# Altium schematic sheet Clock_7Segment.SchDoc
size A3; SheetNumber: 8; SheetTotal: 16
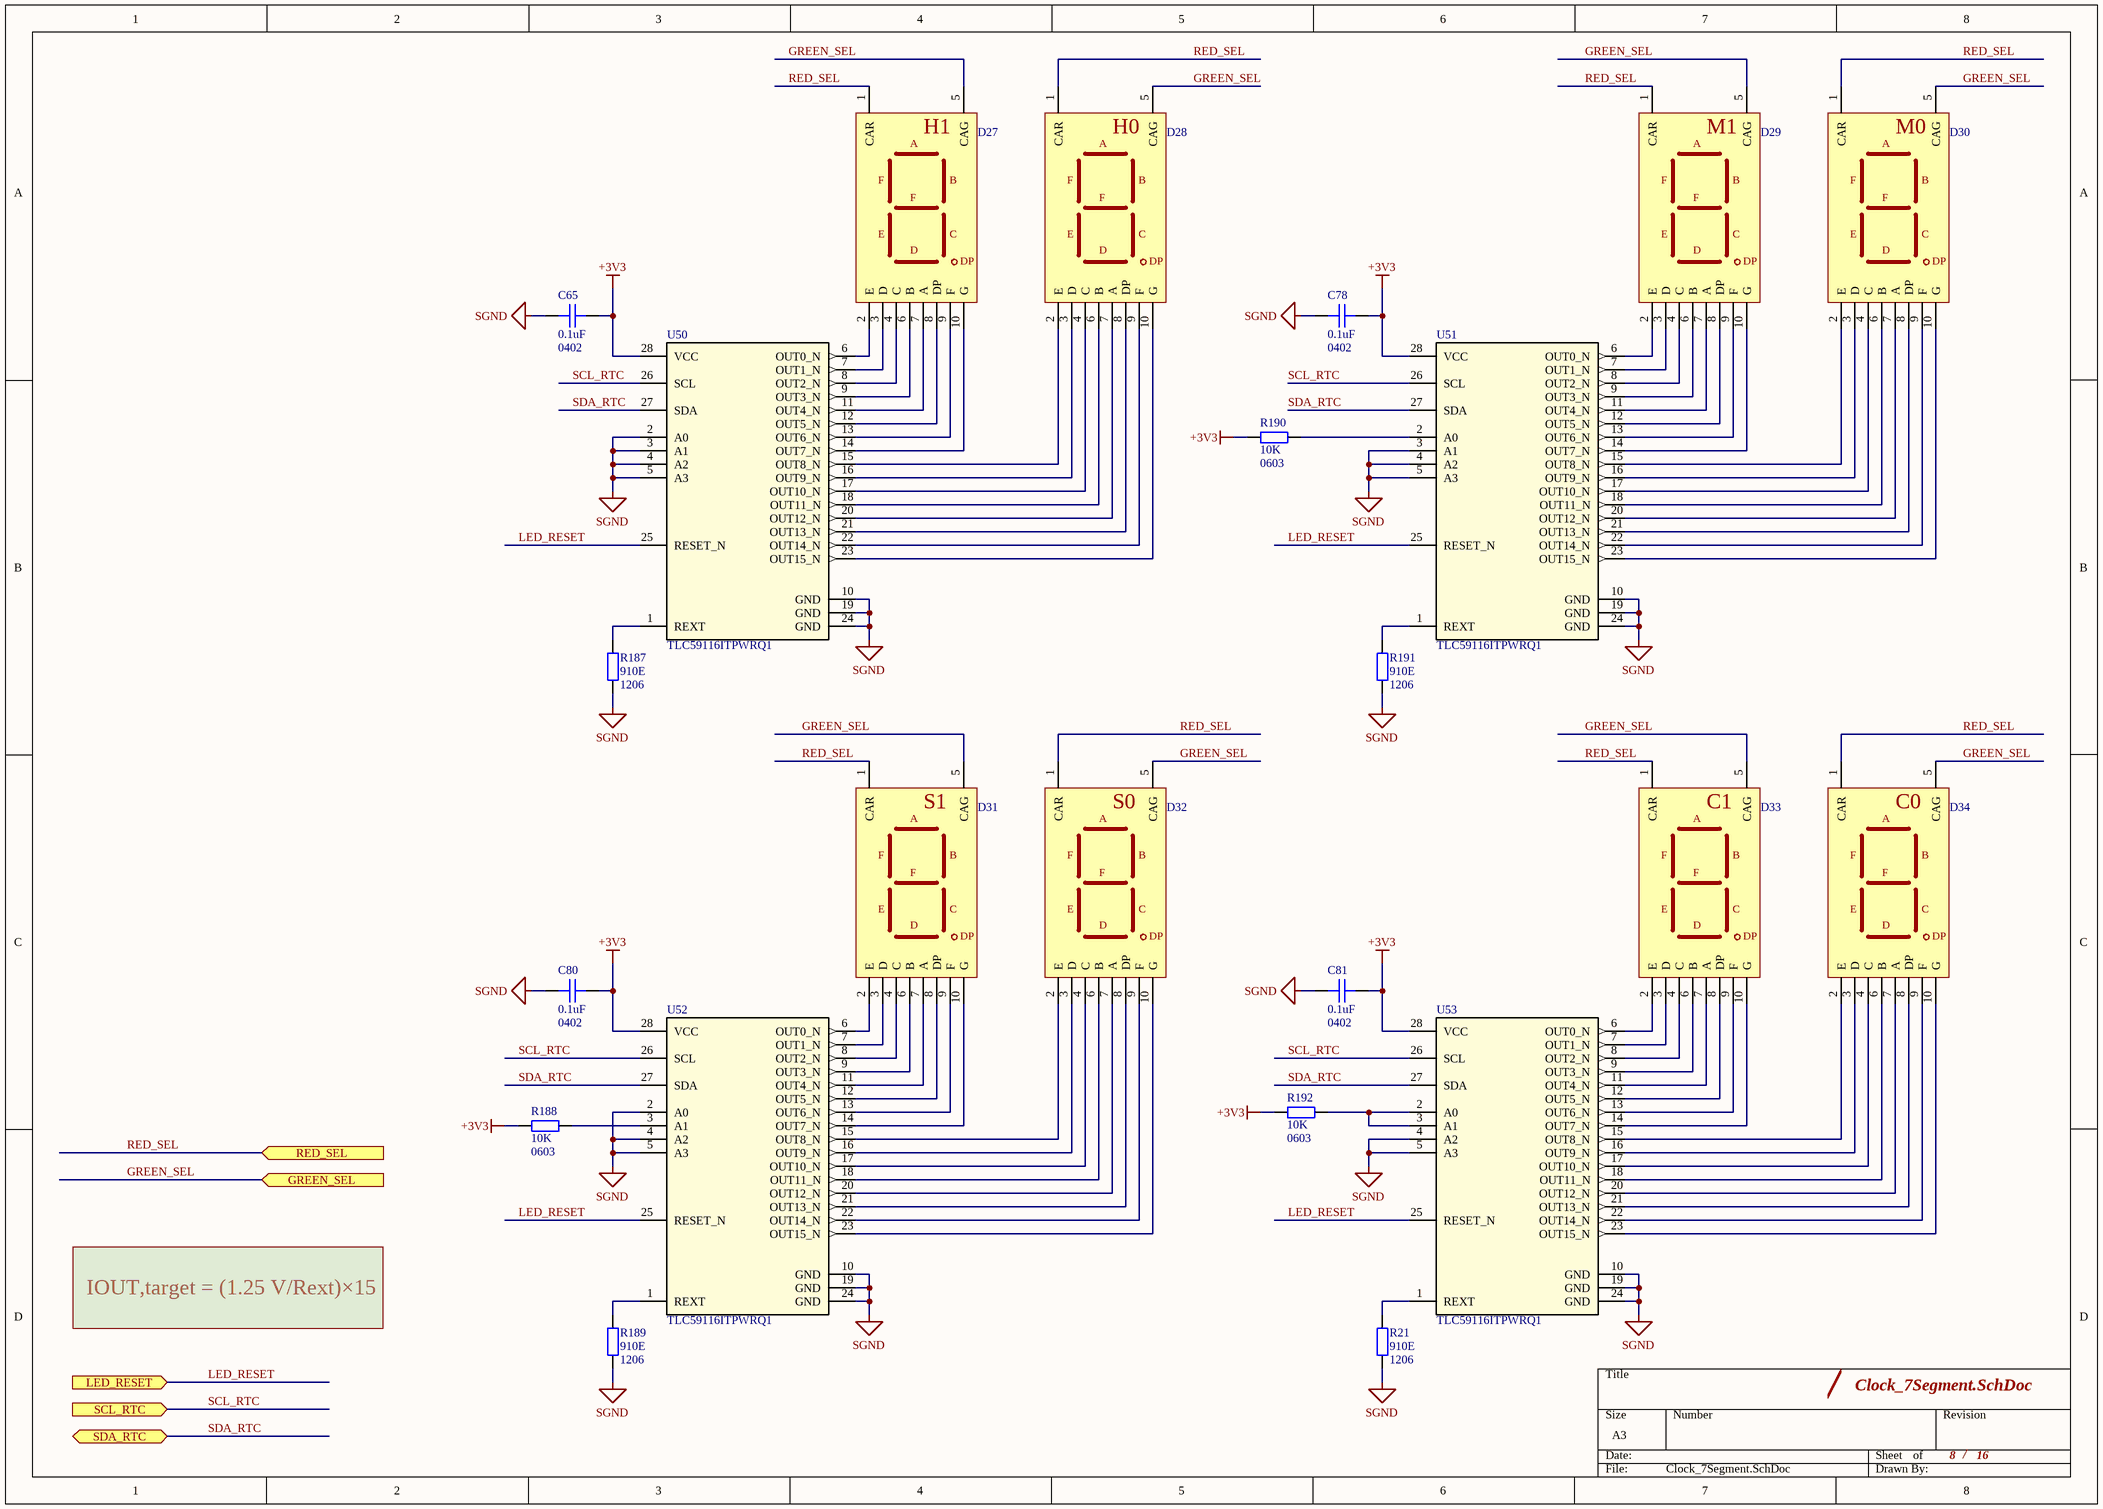
[diagram p0: Clock_7Segment.SchDoc]

## Parts
C65  Capacitance: 0.1uF  Package1: 0402  [CAPC100x50x50L25]  (hidden comment: 04023C104KAT2A)
C78  Capacitance: 0.1uF  Package1: 0402  [CAPC100x50x50L25]  (hidden comment: 04023C104KAT2A)
C80  Capacitance: 0.1uF  Package1: 0402  [CAPC100x50x50L25]  (hidden comment: 04023C104KAT2A)
C81  Capacitance: 0.1uF  Package1: 0402  [CAPC100x50x50L25]  (hidden comment: 04023C104KAT2A)
D27  KEM-15012-BSRSG  [7SEG_1.5inch]  (value not drawn)
D28  KEM-15012-BSRSG  [7SEG_1.5inch]  (value not drawn)
D29  KEM-15012-BSRSG  [7SEG_1.5inch]  (value not drawn)
D30  KEM-15012-BSRSG  [7SEG_1.5inch]  (value not drawn)
D31  KEM-15012-BSRSG  [7SEG_1.5inch]  (value not drawn)
D32  KEM-15012-BSRSG  [7SEG_1.5inch]  (value not drawn)
D33  KEM-15012-BSRSG  [7SEG_1.5inch]  (value not drawn)
D34  KEM-15012-BSRSG  [7SEG_1.5inch]  (value not drawn)
R21  Resistance: 910E  Size2: 1206  [RESC3116X06N]  (hidden comment: RC1206FR-10910RL)
R187  Resistance: 910E  Size2: 1206  [RESC3116X06N]  (hidden comment: RC1206FR-10910RL)
R188  Resistance: 10K  Size2: 0603  [RESC160X80X55L30]  (hidden comment: RC0603FR-0710KL)
R189  Resistance: 910E  Size2: 1206  [RESC3116X06N]  (hidden comment: RC1206FR-10910RL)
R190  Resistance: 10K  Size2: 0603  [RESC160X80X55L30]  (hidden comment: RC0603FR-0710KL)
R191  Resistance: 910E  Size2: 1206  [RESC3116X06N]  (hidden comment: RC1206FR-10910RL)
R192  Resistance: 10K  Size2: 0603  [RESC160X80X55L30]  (hidden comment: RC0603FR-0710KL)
U50  TLC59116ITPWRQ1  [PW0028A_N]
U51  TLC59116ITPWRQ1  [PW0028A_N]
U52  TLC59116ITPWRQ1  [PW0028A_N]
U53  TLC59116ITPWRQ1  [PW0028A_N]

## Ports
GREEN_SEL (in), LED_RESET (in), RED_SEL (in), SCL_RTC (in), SDA_RTC (bidir)

## Nets
+3V3: C65.1 C78.1 C80.1 C81.1 R188.2 R190.2 R192.2 U50.28(VCC) U51.28(VCC) U52.28(VCC) U53.28(VCC)
SGND: C65.2 C78.2 C80.2 C81.2 R21.1 R187.1 R189.1 R191.1 U50.2(A0) U50.3(A1) U50.4(A2) U50.5(A3) U50.10(GND) U50.19(GND) U50.24(GND) U51.3(A1) U51.4(A2) U51.5(A3) U51.10(GND) U51.19(GND) U51.24(GND) U52.2(A0) U52.4(A2) U52.5(A3) U52.10(GND) U52.19(GND) U52.24(GND) U53.4(A2) U53.5(A3) U53.10(GND) U53.19(GND) U53.24(GND)
GREEN_SEL: D27.5(CAG) D28.5(CAG) D29.5(CAG) D30.5(CAG) D31.5(CAG) D32.5(CAG) D33.5(CAG) D34.5(CAG) ; port GREEN_SEL
LED_RESET: U50.25(RESET_N) U51.25(RESET_N) U52.25(RESET_N) U53.25(RESET_N) ; port LED_RESET
RED_SEL: D27.1(CAR) D28.1(CAR) D29.1(CAR) D30.1(CAR) D31.1(CAR) D32.1(CAR) D33.1(CAR) D34.1(CAR) ; port RED_SEL
SCL_RTC: U50.26(SCL) U51.26(SCL) U52.26(SCL) U53.26(SCL) ; port SCL_RTC
SDA_RTC: U50.27(SDA) U51.27(SDA) U52.27(SDA) U53.27(SDA) ; port SDA_RTC
NetD27_2: D27.2(E) U50.6(OUT0_N)
NetD27_3: D27.3(D) U50.7(OUT1_N)
NetD27_4: D27.4(C) U50.8(OUT2_N)
NetD27_6: D27.6(B) U50.9(OUT3_N)
NetD27_7: D27.7(A) U50.11(OUT4_N)
NetD27_8: D27.8(DP) U50.12(OUT5_N)
NetD27_9: D27.9(F) U50.13(OUT6_N)
NetD27_10: D27.10(G) U50.14(OUT7_N)
NetD28_2: D28.2(E) U50.15(OUT8_N)
NetD28_3: D28.3(D) U50.16(OUT9_N)
NetD28_4: D28.4(C) U50.17(OUT10_N)
NetD28_6: D28.6(B) U50.18(OUT11_N)
NetD28_7: D28.7(A) U50.20(OUT12_N)
NetD28_8: D28.8(DP) U50.21(OUT13_N)
NetD28_9: D28.9(F) U50.22(OUT14_N)
NetD28_10: D28.10(G) U50.23(OUT15_N)
NetD29_2: D29.2(E) U51.6(OUT0_N)
NetD29_3: D29.3(D) U51.7(OUT1_N)
NetD29_4: D29.4(C) U51.8(OUT2_N)
NetD29_6: D29.6(B) U51.9(OUT3_N)
NetD29_7: D29.7(A) U51.11(OUT4_N)
NetD29_8: D29.8(DP) U51.12(OUT5_N)
NetD29_9: D29.9(F) U51.13(OUT6_N)
NetD29_10: D29.10(G) U51.14(OUT7_N)
NetD30_2: D30.2(E) U51.15(OUT8_N)
NetD30_3: D30.3(D) U51.16(OUT9_N)
NetD30_4: D30.4(C) U51.17(OUT10_N)
NetD30_6: D30.6(B) U51.18(OUT11_N)
NetD30_7: D30.7(A) U51.20(OUT12_N)
NetD30_8: D30.8(DP) U51.21(OUT13_N)
NetD30_9: D30.9(F) U51.22(OUT14_N)
NetD30_10: D30.10(G) U51.23(OUT15_N)
NetD31_2: D31.2(E) U52.6(OUT0_N)
NetD31_3: D31.3(D) U52.7(OUT1_N)
NetD31_4: D31.4(C) U52.8(OUT2_N)
NetD31_6: D31.6(B) U52.9(OUT3_N)
NetD31_7: D31.7(A) U52.11(OUT4_N)
NetD31_8: D31.8(DP) U52.12(OUT5_N)
NetD31_9: D31.9(F) U52.13(OUT6_N)
NetD31_10: D31.10(G) U52.14(OUT7_N)
NetD32_2: D32.2(E) U52.15(OUT8_N)
NetD32_3: D32.3(D) U52.16(OUT9_N)
NetD32_4: D32.4(C) U52.17(OUT10_N)
NetD32_6: D32.6(B) U52.18(OUT11_N)
NetD32_7: D32.7(A) U52.20(OUT12_N)
NetD32_8: D32.8(DP) U52.21(OUT13_N)
NetD32_9: D32.9(F) U52.22(OUT14_N)
NetD32_10: D32.10(G) U52.23(OUT15_N)
NetD33_2: D33.2(E) U53.6(OUT0_N)
NetD33_3: D33.3(D) U53.7(OUT1_N)
NetD33_4: D33.4(C) U53.8(OUT2_N)
NetD33_6: D33.6(B) U53.9(OUT3_N)
NetD33_7: D33.7(A) U53.11(OUT4_N)
NetD33_8: D33.8(DP) U53.12(OUT5_N)
NetD33_9: D33.9(F) U53.13(OUT6_N)
NetD33_10: D33.10(G) U53.14(OUT7_N)
NetD34_2: D34.2(E) U53.15(OUT8_N)
NetD34_3: D34.3(D) U53.16(OUT9_N)
NetD34_4: D34.4(C) U53.17(OUT10_N)
NetD34_6: D34.6(B) U53.18(OUT11_N)
NetD34_7: D34.7(A) U53.20(OUT12_N)
NetD34_8: D34.8(DP) U53.21(OUT13_N)
NetD34_9: D34.9(F) U53.22(OUT14_N)
NetD34_10: D34.10(G) U53.23(OUT15_N)
NetR21_2: R21.2 U53.1(REXT)
NetR187_2: R187.2 U50.1(REXT)
NetR188_1: R188.1 U52.3(A1)
NetR189_2: R189.2 U52.1(REXT)
NetR190_1: R190.1 U51.2(A0)
NetR191_2: R191.2 U51.1(REXT)
NetR192_1: R192.1 U53.2(A0) U53.3(A1)

## Notes on the sheet
- (near D27) H1
- (near D28) H0
- (near D29) M1
- (near D30) M0
- (near D31) S1
- (near D32) S0
- (near D33) C1
- (near D34) C0
- IOUT,target = (1.25 V/Rext)×15
- /

## Library data of the parts
C65 C78 C80 C81 = CMP-001-0374-4: 0402 25V X7R 100 NF 10%; Manufacturer: KYOCERA AVX; Op Temp max: 85°C; Op Temp min: -55°C; ComponentLink3URL: https://www.digikey.com/en/products/detail/yageo/CC0402MRX5R5BB106/5195138; MPN: 04023C104KAT2A; ComponentLink1URL: https://www.yageo.com/upload/media/product/productsearch/datasheet/mlcc/UPY-GPHC_X5R_4V-to-50V_26.pdf; Package: 0402 (1005 Metric); Size: 1.00mm x 0.50mm; Height max: 700µm; Mounting Type: SM; Tolerance: 10%; ComponentLink1Description: Datasheet; ComponentLink3Description: Digikey; Ratings: -; Dielectric: X7R; ComponentLink2Description: Mouser; ComponentLink2URL: https://eu.mouser.com/ProductDetail/YAGEO/CC0402MRX5R5BB106?qs=zEY9bCHj09eCmUJdZuS5Lg%3D%3D; Lead Spacing: 0mm; Component Type: Ceramic Capacitor; Voltage Rating: 25V
D27-D34 = 7SEG_Houkem-15012-BSRSG: 7 segment indicator; MPN: Houkem-15012-BSRSG
R21 R187 R189 R191 = RC_1206: RES 910 OHM 1% 1/4W 1206; MF: YAGEO; Power: 0.25W; Datasheet: https://www.yageo.com/upload/media/product/products/datasheet/rchip/PYu-RC_Group_51_RoHS_L_12.pdf; DigiKey: https://www.digikey.com/en/products/detail/yageo/RC1206FR-10910RL/14286762; Package: 1206 (3216 Metric); MPN: RC1206FR-10910RL
R188 R190 R192 = CMP-001-0628-7: RES 10K OHM 1% 1/10W 0603; Manufacturer: YAGEO; Power: 100mW; Temperature Coefficient: ±100ppm; Op Temp max: 155°C; Op Temp min: -55°C; PMNT: DNP; Ratings: -; ComponentLink3URL: https://www.digikey.com/en/products/detail/yageo/RC0603FR-0710KL/726880?s=N4IgTCBcDaIEoGEAMA2JBmAYnAtEg7AIxIDSAMiALoC%2BQA; Size: 1.60mm x 0.80mm; ComponentLink1Description: Datasheet; ComponentLink3Description: Digikey; ComponentLink2Description: Mouser; ComponentLink1URL: https://www.yageo.com/upload/media/product/products/datasheet/rchip/PYu-RC_51_RoHS_P_4.pdf; Composition: Thick Film; Package: 0603 (1608 Metric); ComponentLink2URL: https://eu.mouser.com/ProductDetail/YAGEO/RC0603FR-0710KL?qs=grNVn54RoB%252B3GtjbJj3wJQ%3D%3D; Mounting Type: SM; Tolerance: 1%; Height max: 550µm; MPN: RC0603FR-0710KL; Component Type: Chip Resistor
U50-U53 = TLC59116ITPWRQ1: IC LED DRV LIN I2C 120MA 28TSSOP; Mfr_Name: Texas Instruments; Type: DEV; RefDes: RefDes; Copyright: Copyright (C) 2024 Ultra Librarian. All rights reserved.; MPN: TLC59116ITPWRQ1; ComponentLink1Description: Datasheet; ComponentLink1URL: https://www.ti.com/lit/ds/symlink/tlc59116-q1.pdf?ts=1707339950007&ref_url=https%253A%252F%252Fwww.ti.com%252Fproduct%252FTLC59116-Q1; ComponentLink2Description: DigiKey; ComponentLink2URL: https://www.digikey.com/en/products/detail/texas-instruments/tlc59116itpwrq1/6005364